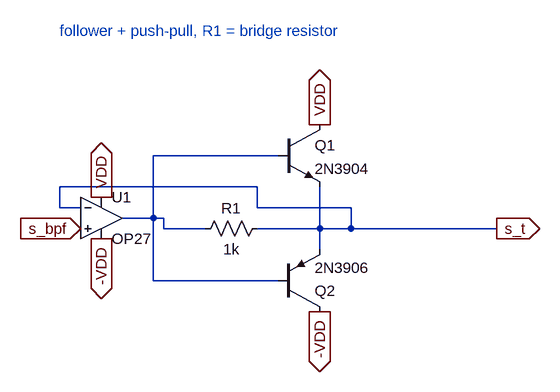
[diagram p0: schematic Buffer_Amplifier.asc]
Buffer_Amplifier.asc, the LTspice schematic file:
Version 4.1
SHEET 1 892 680
WIRE -576 -576 -768 -576
WIRE -608 -528 -912 -528
WIRE -912 -496 -912 -528
WIRE -880 -496 -912 -496
WIRE -608 -496 -608 -528
WIRE -464 -496 -608 -496
WIRE -768 -480 -768 -576
WIRE -768 -480 -816 -480
WIRE -752 -480 -768 -480
WIRE -752 -464 -752 -480
WIRE -688 -464 -752 -464
WIRE -512 -464 -512 -528
WIRE -512 -464 -608 -464
WIRE -464 -464 -464 -496
WIRE -464 -464 -512 -464
WIRE -240 -464 -464 -464
WIRE -512 -432 -512 -464
WIRE -768 -384 -768 -480
WIRE -576 -384 -768 -384
FLAG -848 -512 VDD
IOPIN -848 -512 Out
FLAG -848 -448 -VDD
IOPIN -848 -448 Out
FLAG -512 -336 -VDD
IOPIN -512 -336 Out
FLAG -512 -624 VDD
IOPIN -512 -624 Out
FLAG -880 -464 s_bpf
IOPIN -880 -464 In
FLAG -240 -464 s_t
IOPIN -240 -464 Out
SYMBOL npn -576 -624 R0
SYMATTR InstName Q1
SYMATTR Value 2N3904
SYMBOL pnp -576 -336 M180
SYMATTR InstName Q2
SYMATTR Value 2N3906
SYMBOL OpAmps\\OP27 -848 -544 R0
SYMATTR InstName U1
SYMBOL res -592 -480 R90
WINDOW 0 0 56 VBottom 2
WINDOW 3 32 56 VTop 2
SYMATTR InstName R1
SYMATTR Value 1k
TEXT -912 -768 Left 2 ;follower + push-pull, R1 = bridge resistor

The netlist it stands for:
* Buffer_Amplifier.asc
Q1 VDD N001 s_t 0 2N3904
Q2 -VDD N001 s_t 0 2N3906
X§U1 s_bpf s_t VDD -VDD N001 OP27  ; pins In+ In- V+ V- OUT
R1 s_t N001 1k
.model NPN NPN
.model PNP PNP
.lib standard.bjt
* follower + push-pull, R1 = bridge resistor
.lib ADI.lib
.backanno
.end